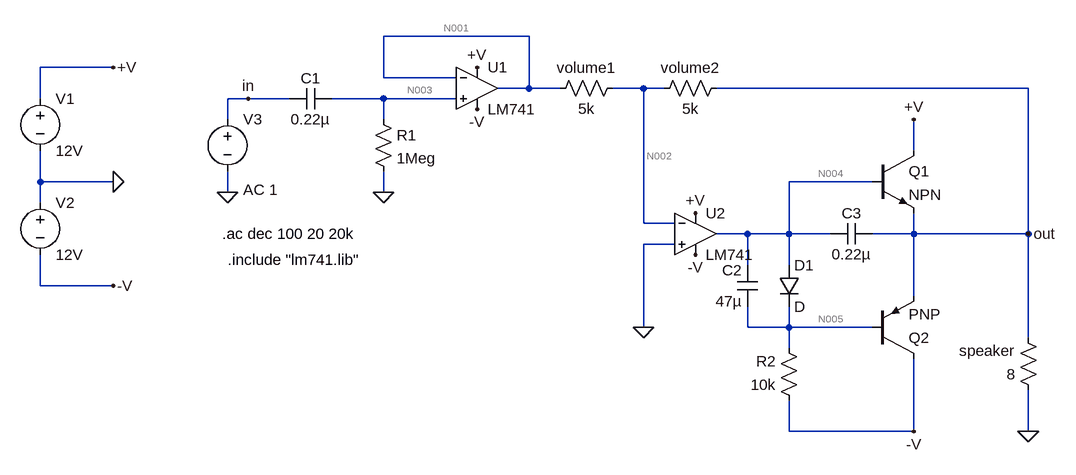
[diagram p0: schematic 03_LM741_Diode_Transistor.asc]
03_LM741_Diode_Transistor.asc, the LTspice schematic file:
Version 4.1
SHEET 1 1876 680
WIRE 768 16 544 16
WIRE 128 64 16 64
WIRE 544 80 544 16
WIRE 656 80 544 80
WIRE 768 96 768 16
WIRE 768 96 720 96
WIRE 816 96 768 96
WIRE 944 96 896 96
WIRE 976 96 944 96
WIRE 1536 96 1056 96
WIRE 16 112 16 64
WIRE 336 112 304 112
WIRE 400 112 336 112
WIRE 544 112 464 112
WIRE 656 112 544 112
WIRE 304 144 304 112
WIRE 544 144 544 112
WIRE 1360 192 1360 144
WIRE 16 240 16 192
WIRE 128 240 16 240
WIRE 1296 240 1168 240
WIRE 304 256 304 224
WIRE 544 256 544 224
WIRE 16 272 16 240
WIRE 944 304 944 96
WIRE 992 304 944 304
WIRE 1104 320 1056 320
WIRE 1168 320 1168 240
WIRE 1168 320 1104 320
WIRE 1232 320 1168 320
WIRE 1360 320 1360 288
WIRE 1360 320 1296 320
WIRE 1536 320 1536 96
WIRE 1536 320 1360 320
WIRE 992 336 944 336
WIRE 1104 368 1104 320
WIRE 1168 368 1168 320
WIRE 16 400 16 352
WIRE 128 400 16 400
WIRE 1360 416 1360 320
WIRE 944 464 944 336
WIRE 1104 464 1104 432
WIRE 1168 464 1168 432
WIRE 1168 464 1104 464
WIRE 1296 464 1168 464
WIRE 1536 480 1536 320
WIRE 1168 496 1168 464
WIRE 1168 624 1168 576
WIRE 1360 624 1360 512
WIRE 1360 624 1168 624
WIRE 1536 624 1536 560
FLAG 128 64 +V
FLAG 128 400 -V
FLAG 128 240 0
FLAG 336 112 in
FLAG 544 256 0
FLAG 688 128 -V
FLAG 688 64 +V
FLAG 1024 352 -V
FLAG 1024 288 +V
FLAG 1536 624 0
FLAG 944 464 0
FLAG 1360 144 +V
FLAG 1360 624 -V
FLAG 304 256 0
FLAG 1536 320 out
SYMBOL voltage 16 96 R0
WINDOW 123 0 0 Left 0
WINDOW 39 0 0 Left 0
SYMATTR InstName V1
SYMATTR Value 12V
SYMBOL voltage 16 256 R0
WINDOW 123 0 0 Left 0
WINDOW 39 0 0 Left 0
SYMATTR InstName V2
SYMATTR Value 12V
SYMBOL res 528 128 R0
SYMATTR InstName R1
SYMATTR Value 1Meg
SYMBOL res 912 80 R90
WINDOW 0 0 56 VBottom 2
WINDOW 3 32 56 VTop 2
SYMATTR InstName volume1
SYMATTR Value 5k
SYMBOL cap 464 96 R90
WINDOW 0 0 32 VBottom 2
WINDOW 3 32 32 VTop 2
SYMATTR InstName C1
SYMATTR Value 0.22µ
SYMBOL cap 1120 432 R180
WINDOW 0 24 56 Left 2
WINDOW 3 24 8 Left 2
SYMATTR InstName C2
SYMATTR Value 47µ
SYMBOL cap 1296 304 R90
WINDOW 0 0 32 VBottom 2
WINDOW 3 32 32 VTop 2
SYMATTR InstName C3
SYMATTR Value 0.22µ
SYMBOL res 1552 576 R180
WINDOW 0 36 76 Left 2
WINDOW 3 36 40 Left 2
SYMATTR InstName speaker
SYMATTR Value 8
SYMBOL res 1184 592 R180
WINDOW 0 36 76 Left 2
WINDOW 3 36 40 Left 2
SYMATTR InstName R2
SYMATTR Value 10k
SYMBOL diode 1152 368 R0
SYMATTR InstName D1
SYMBOL npn 1296 192 R0
SYMATTR InstName Q1
SYMBOL pnp 1296 512 M180
SYMATTR InstName Q2
SYMBOL voltage 304 128 R0
WINDOW 3 24 96 Invisible 2
WINDOW 123 24 124 Left 2
WINDOW 39 0 0 Left 0
SYMATTR Value 12V
SYMATTR Value2 AC 1
SYMATTR InstName V3
SYMBOL res 1072 80 R90
WINDOW 0 0 56 VBottom 2
WINDOW 3 32 56 VTop 2
SYMATTR InstName volume2
SYMATTR Value 5k
SYMBOL OpAmps\\opamp2 688 32 R0
SYMATTR InstName U1
SYMATTR Value LM741
SYMBOL OpAmps\\opamp2 1024 256 R0
SYMATTR InstName U2
SYMATTR Value LM741
TEXT 296 320 Left 2 !.ac dec 100 20 20k
TEXT 304 360 Left 2 !.include "lm741.lib"

The netlist it stands for:
* 03_LM741_Diode_Transistor.asc
V1 +V 0 12V
V2 0 -V 12V
R1 N003 0 1Meg
R§volume1 N002 N001 5k
C1 N003 in 0.22µ
C2 N005 N004 47µ
C3 out N004 0.22µ
R§speaker 0 out 8
R2 -V N005 10k
D1 N004 N005 D
Q1 +V N004 out 0 NPN
Q2 -V N005 out 0 PNP
V3 in 0 12V AC 1
R§volume2 out N002 5k
X§U1 N003 N001 +V -V N001 LM741  ; pins In+ In- V+ V- OUT
X§U2 0 N002 +V -V N004 LM741  ; pins In+ In- V+ V- OUT
.model D D
.lib standard.dio
.model NPN NPN
.model PNP PNP
.lib standard.bjt
.ac dec 100 20 20k
.include "lm741.lib"
.backanno
.end

* Results of the author's LTspice run, read from the files saved beside the schematic
* Operating Point, zero values left out:
*   V(+v) = 12 V
*   V(-v) = -12 V
*   V(in) = 12 V
*   V(n001) = -56.86 mV
*   V(n002) = 995.1 µV
*   V(n003) = -57.86 mV
*   V(n004) = 885.2 mV
*   V(n005) = 224.9 mV
*   V(out) = 59.36 mV
*   I(D1) = 1.222 mA
*   I(R1) = -57.86 nA
*   I(R2) = -1.222 mA
*   I(V1) = -11.83 mA
*   I(V2) = -4.406 mA
*   I(speaker) = -7.421 mA
*   I(volume1) = 11.57 µA
*   I(volume2) = 11.67 µA
*   Ib(Q1) = 73.59 µA
*   Ib(Q2) = 12.39 pA
*   Ic(Q1) = 7.359 mA
*   Ic(Q2) = -12.23 pA
*   Ie(Q1) = -7.432 mA
*   Ix(u1:1) = 57.86 nA
*   Ix(u1:2) = 101.9 nA
*   Ix(u1:28) = 11.47 µA
*   Ix(u1:50) = -1.632 mA
*   Ix(u1:99) = 1.621 mA
*   Ix(u2:1) = 57.88 nA
*   Ix(u2:2) = 101.8 nA
*   Ix(u2:28) = -1.296 mA
*   Ix(u2:50) = -1.551 mA
*   Ix(u2:99) = 2.847 mA
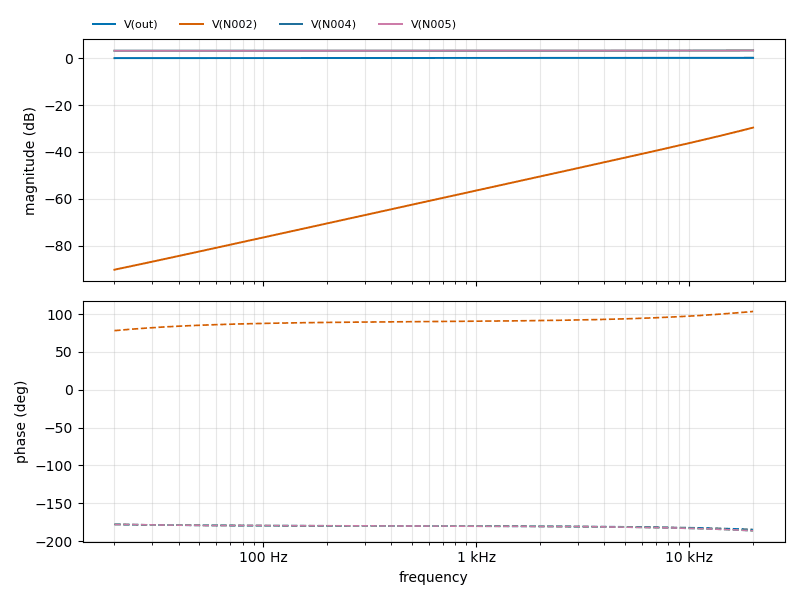
[diagram p1: AC Analysis of 03_LM741_Diode_Transistor.asc, plotted from the saved traces]
* AC Analysis, 1 run:
*   V(out): -0.01 dB at 20 Hz, 0.16 dB at 20 kHz, peak 0.16 dB at 20 kHz
*   V(N002): -90.22 dB at 20 Hz, -29.63 dB at 20 kHz, peak -29.63 dB at 20 kHz, 3 dB below the peak at 14.75 kHz
*   V(N004): 3.14 dB at 20 Hz, 3.28 dB at 20 kHz, peak 3.28 dB at 20 kHz
*   V(N005): 3.12 dB at 20 Hz, 3.28 dB at 20 kHz, peak 3.28 dB at 20 kHz